# Altium schematic sheet 03_MICROSD.SchDoc
size A3; SheetNumber: 3; SheetTotal: 7
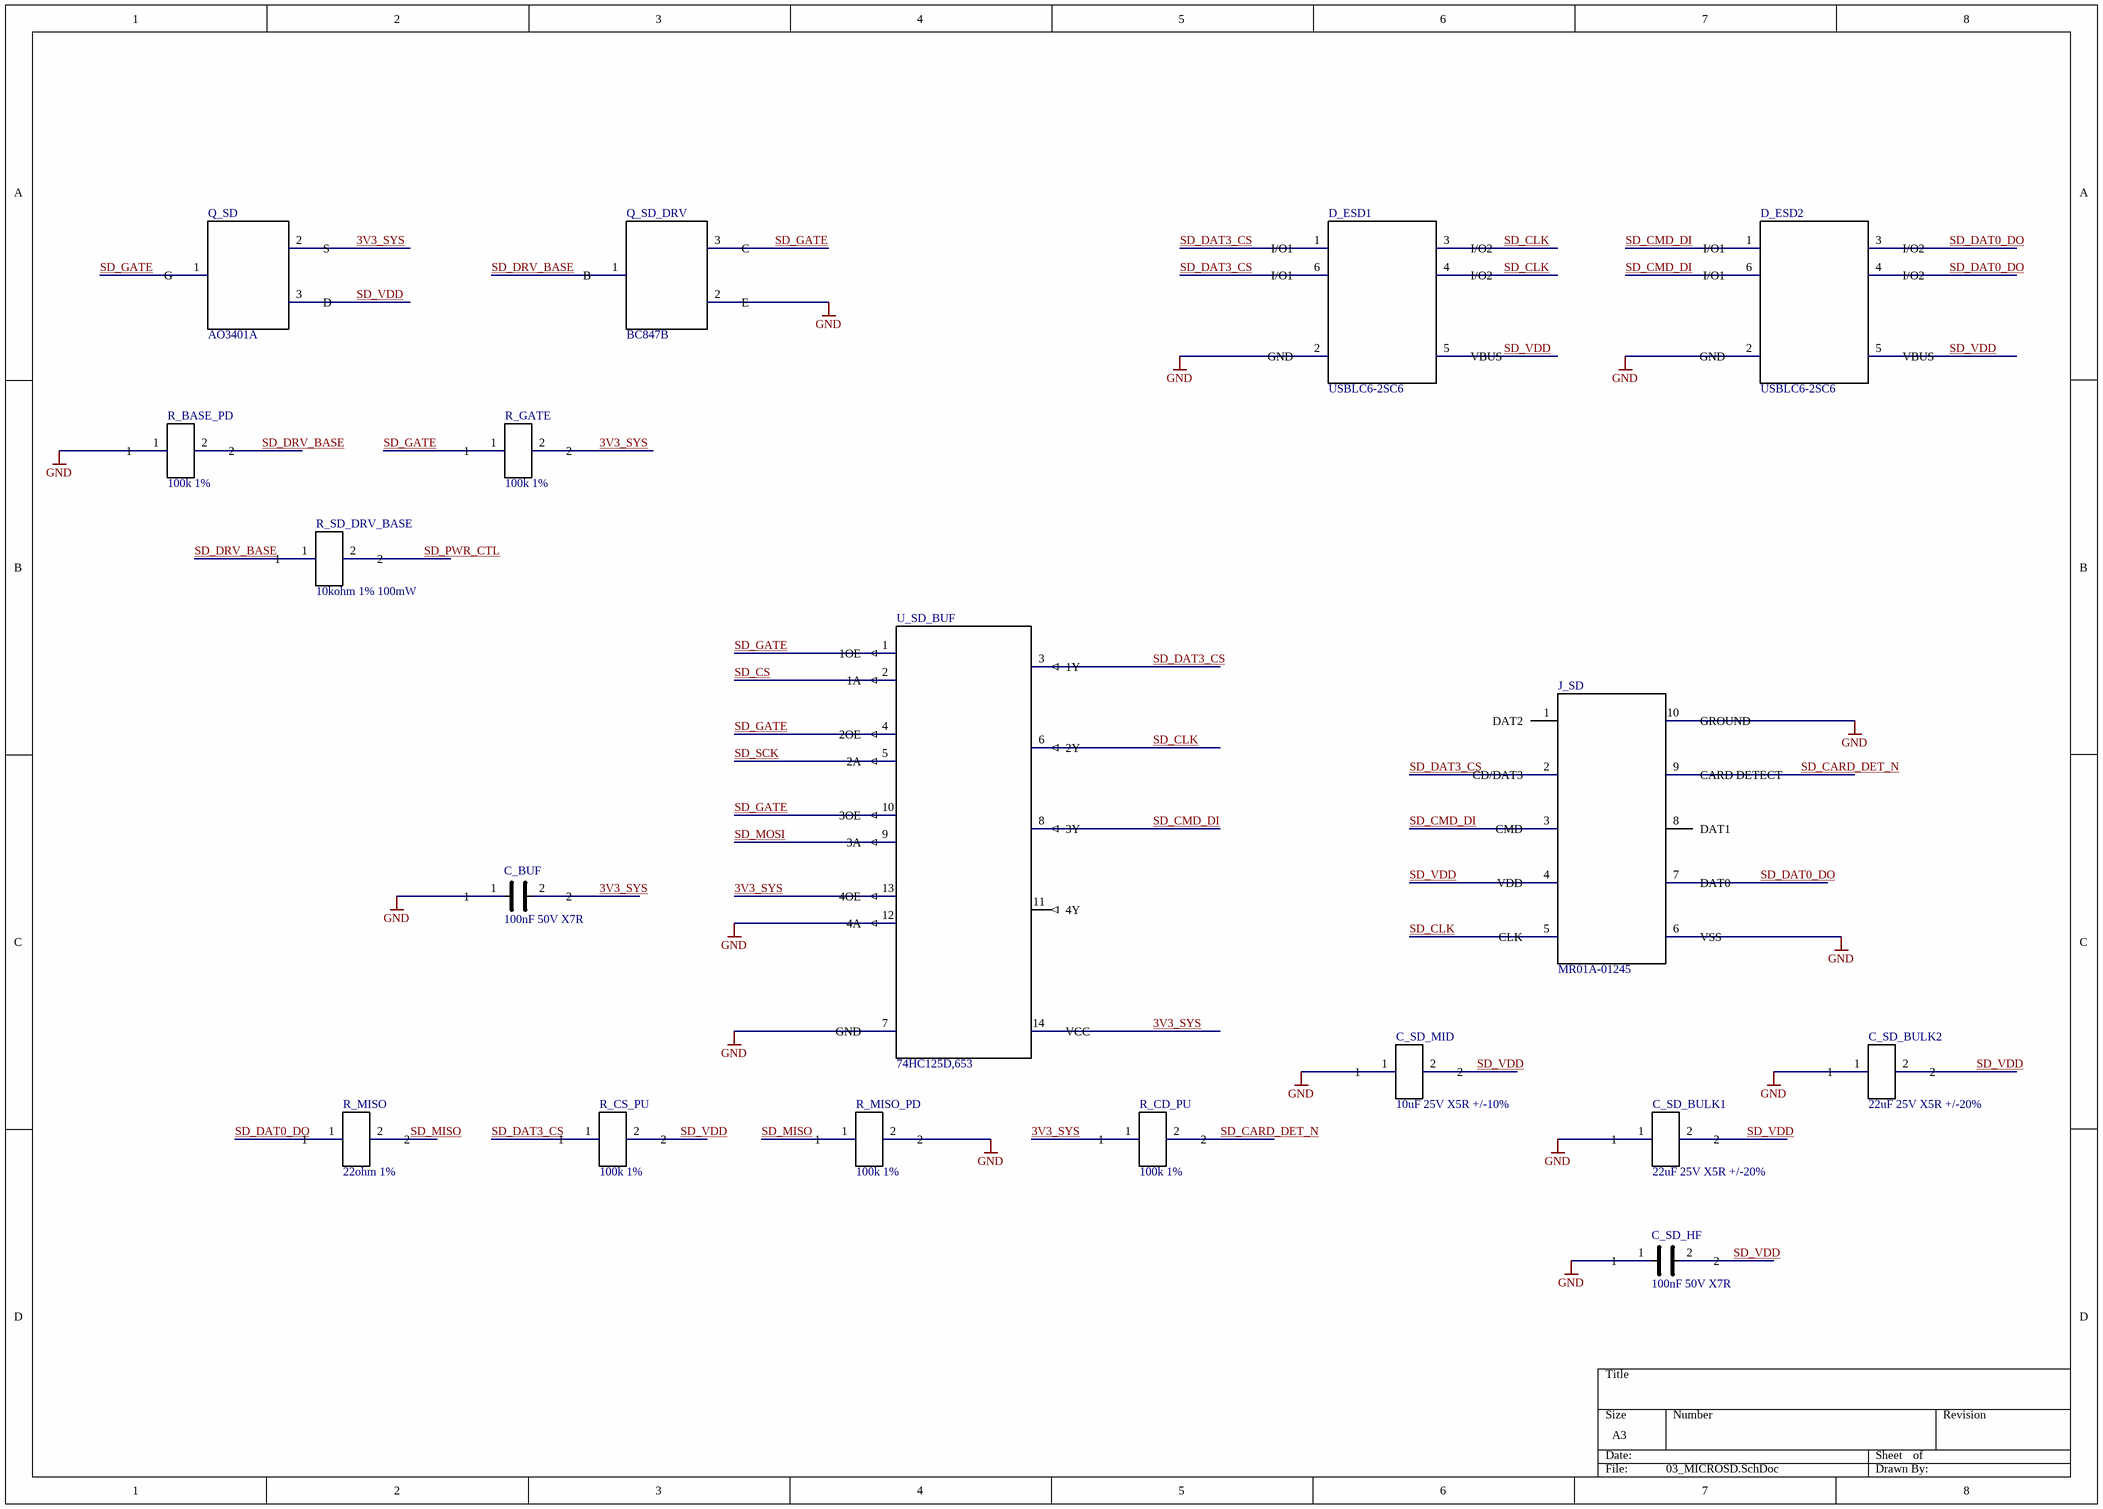
[diagram p0: 03_MICROSD.SchDoc]

## Parts
C_BUF  100nF 50V X7R  [SAMSUNG_CL10_0603_CAP_2P]
C_SD_BULK1  22uF 25V X5R +/-20%  [TDK_C2012_0805_REFLOW_2P]
C_SD_BULK2  22uF 25V X5R +/-20%  [TDK_C2012_0805_REFLOW_2P]
C_SD_HF  100nF 50V X7R  [SAMSUNG_CL10_0603_CAP_2P]
C_SD_MID  10uF 25V X5R +/-10%  [MURATA_GRM21_0805_CAP_2P]
D_ESD1  USBLC6-2SC6  [ST_SOT23_6L_USBLC6_6P]
D_ESD2  USBLC6-2SC6  [ST_SOT23_6L_USBLC6_6P]
J_SD  MR01A-01245  [ATOM_MR01A_01245_10P]
Q_SD  AO3401A  [AOS_SOT23_AO3401A_3P]
Q_SD_DRV  BC847B  [NEXPERIA_SOT23_TO236AB_3P]
R_BASE_PD  100k 1%  [RES_0603_SHARED_2P]
R_CD_PU  100k 1%  [RES_0603_SHARED_2P]
R_CS_PU  100k 1%  [RES_0603_SHARED_2P]
R_GATE  100k 1%  [RES_0603_SHARED_2P]
R_MISO  22ohm 1%  [RES_0603_SHARED_2P]
R_MISO_PD  100k 1%  [RES_0603_SHARED_2P]
R_SD_DRV_BASE  10kohm 1% 100mW  [RES_0603_SHARED_2P]
U_SD_BUF  74HC125D,653  [NEXPERIA_SOT108_1_SO14_14P]

## Nets
GND: C_BUF.1 C_SD_BULK1.1 C_SD_BULK2.1 C_SD_HF.1 C_SD_MID.1 D_ESD1.2(GND) D_ESD2.2(GND) J_SD.6(VSS) J_SD.10(GROUND) Q_SD_DRV.2(E) R_BASE_PD.1 R_MISO_PD.2 U_SD_BUF.7(GND) U_SD_BUF.12(4A)
3V3_SYS: C_BUF.2 Q_SD.2(S) R_CD_PU.1 R_GATE.2 U_SD_BUF.13(4OE) U_SD_BUF.14(VCC)
SD_CARD_DET_N: J_SD.9(CARD_DETECT) R_CD_PU.2
SD_CLK: D_ESD1.3(I/O2) D_ESD1.4(I/O2) J_SD.5(CLK) U_SD_BUF.6(2Y)
SD_CMD_DI: D_ESD2.1(I/O1) D_ESD2.6(I/O1) J_SD.3(CMD) U_SD_BUF.8(3Y)
SD_CS: U_SD_BUF.2(1A)
SD_DAT0_DO: D_ESD2.3(I/O2) D_ESD2.4(I/O2) J_SD.7(DAT0) R_MISO.1
SD_DAT3_CS: D_ESD1.1(I/O1) D_ESD1.6(I/O1) J_SD.2(CD/DAT3) R_CS_PU.1 U_SD_BUF.3(1Y)
SD_DRV_BASE: Q_SD_DRV.1(B) R_BASE_PD.2 R_SD_DRV_BASE.1
SD_GATE: Q_SD.1(G) Q_SD_DRV.3(C) R_GATE.1 U_SD_BUF.1(1OE) U_SD_BUF.4(2OE) U_SD_BUF.10(3OE)
SD_MISO: R_MISO.2 R_MISO_PD.1
SD_MOSI: U_SD_BUF.9(3A)
SD_PWR_CTL: R_SD_DRV_BASE.2
SD_SCK: U_SD_BUF.5(2A)
SD_VDD: C_SD_BULK1.2 C_SD_BULK2.2 C_SD_HF.2 C_SD_MID.2 D_ESD1.5(VBUS) D_ESD2.5(VBUS) J_SD.4(VDD) Q_SD.3(D) R_CS_PU.2

Not connected (* = marked no-connect by the designer): J_SD 1(DAT2) 8(DAT1); U_SD_BUF 11(4Y)

## Library data of the parts
C_BUF C_SD_HF = CL10B104KB8NNNC: MCU-core ceramic capacitor; Manufacturer: Samsung Electro-Mechanics; Source_Baseline: MCU_SCHEMATIC_ENTRY_BASELINE_v2.1_FA.txt; Design_Status: DESIGN_LOCK_MCU_CORE_V2.1_FOOTPRINT_HOLD; Qualification_Status: UNQUALIFIED_PENDING_SAVE_REOPEN_AUDIT; PIN_NUMBER_SOURCE: INTERNAL_CONVENTION; PIN_FUNCTION_SOURCE: MANUFACTURER_DATASHEET; MPN: CL10B104KB8NNNC; Value: 100nF 50V X7R; Package: 0603 / 1608 metric; Datasheet: https://product.samsungsem.com/mlcc/CL10B104KB8NNN.do
C_SD_BULK1 C_SD_BULK2 = C2012X5R1E226M125AC: MicroSD local bulk ceramic capacitor; Manufacturer: TDK; Source_Baseline: MICROSD_SCHEMATIC_ENTRY_BASELINE_v1.2_FA.txt; Design_Status: DESIGN_LOCK_MICROSD_V1.2_REUSE_CANDIDATE_PENDING_LINK; Qualification_Status: UNQUALIFIED_PENDING_SAVE_REOPEN_AUDIT; PIN_NUMBER_SOURCE: INTERNAL_CONVENTION_1_2; PIN_FUNCTION_SOURCE: MANUFACTURER_PRODUCT_DATA; MPN: C2012X5R1E226M125AC; Value: 22uF 25V X5R +/-20%; Package: C2012 / EIA 0805; Datasheet: https://product.tdk.com/en/search/capacitor/ceramic/mlcc/info?part_no=C2012X5R1E226M125AC
C_SD_MID = GRM21BR61E106KA73L: MicroSD local mid-value ceramic capacitor; Manufacturer: Murata Manufacturing; Source_Baseline: MICROSD_SCHEMATIC_ENTRY_BASELINE_v1.2_FA.txt; Design_Status: DESIGN_LOCK_MICROSD_V1.2_FOOTPRINT_COMPARE_PENDING; Qualification_Status: UNQUALIFIED_PENDING_SAVE_REOPEN_AUDIT; PIN_NUMBER_SOURCE: INTERNAL_CONVENTION_1_2; PIN_FUNCTION_SOURCE: MANUFACTURER_PRODUCT_DATA; MPN: GRM21BR61E106KA73L; Value: 10uF 25V X5R +/-10%; Package: 2012M / EIA 0805; Datasheet: https://pim.murata.com/en-global/pim/details/?partNum=GRM21BR61E106KA73%23
D_ESD1 D_ESD2 = USBLC6-2SC6: Two-line low-capacitance ESD protector; ST device purchased for Rev-A; Manufacturer: STMicroelectronics; Source_Baseline: MICROSD_SCHEMATIC_ENTRY_BASELINE_v1.2_FA.txt; Design_Status: DESIGN_LOCK_MICROSD_V1.2_ST_PROCUREMENT; Qualification_Status: UNQUALIFIED_PENDING_SAVE_REOPEN_AUDIT; PIN_NUMBER_SOURCE: MANUFACTURER_DATASHEET; MPN: USBLC6-2SC6; Value: USBLC6-2SC6; Package: SOT23-6L; Datasheet: https://www.st.com/resource/en/datasheet/usblc6-2.pdf; PIN_FUNCTION_SOURCE: MANUFACTURER_DATASHEET
J_SD = MR01A-01245: microSD socket with card detect; pin table controlled by ATOM-A10248 Rev A0; Manufacturer: Shenzhen ATOM Technology; Source_Baseline: MICROSD_SCHEMATIC_ENTRY_BASELINE_v1.2_FA.txt; Design_Status: DESIGN_LOCK_MICROSD_V1.2_SOCKET_DRAWING; Qualification_Status: UNQUALIFIED_PENDING_SAVE_REOPEN_AUDIT; PIN_NUMBER_SOURCE: MANUFACTURER_DRAWING; MPN: MR01A-01245; Value: MR01A-01245; Package: Right-angle SMD/SMT microSD socket; Datasheet: ATOM-A10248 Rev A0 controlled local manufacturer drawing; PIN_FUNCTION_SOURCE: MANUFACTURER_DRAWING
Q_SD = AO3401A: -30V P-channel MOSFET used as switched SD_VDD high-side pass element; Manufacturer: Alpha & Omega Semiconductor; Source_Baseline: MICROSD_SCHEMATIC_ENTRY_BASELINE_v1.2_FA.txt; Design_Status: DESIGN_LOCK_MICROSD_V1.2_PIN_NUMBER_CONVENTION_PENDING_FOOTPRINT_CROSSCHECK; Qualification_Status: UNQUALIFIED_PENDING_SAVE_REOPEN_AUDIT; PIN_NUMBER_SOURCE: INTERNAL_CONVENTION_PENDING_PHYSICAL_ORIENTATION_CROSSCHECK; PIN_FUNCTION_SOURCE: MANUFACTURER_DATASHEET; MPN: AO3401A; Value: AO3401A; Package: SOT-23; Datasheet: https://www.aosmd.com/sites/default/files/res/datasheets/AO3401A.pdf
Q_SD_DRV = BC847B: 45V 100mA NPN general-purpose transistor used as SD gate driver; Manufacturer: Nexperia; Source_Baseline: MICROSD_SCHEMATIC_ENTRY_BASELINE_v1.2_FA.txt; Design_Status: DESIGN_LOCK_MICROSD_V1.2; Qualification_Status: UNQUALIFIED_PENDING_SAVE_REOPEN_AUDIT; PIN_NUMBER_SOURCE: MANUFACTURER_DATASHEET; MPN: BC847B; Value: BC847B; Package: SOT-23 / TO-236AB; Datasheet: https://assets.nexperia.com/documents/data-sheet/BC847X_SER.pdf; PIN_FUNCTION_SOURCE: MANUFACTURER_DATASHEET
R_BASE_PD R_CD_PU R_CS_PU R_GATE R_MISO_PD = 0603WAF1003T5E: OVP resistor; Manufacturer: UNI-ROYAL; Source_Baseline: POWER_SCHEMATIC_ENTRY_BASELINE_v0.17_FA.txt; Design_Status: CONTROLLED_V0.17_P9; Qualification_Status: UNQUALIFIED_PENDING_SAVE_REOPEN_AUDIT; PIN_NUMBER_SOURCE: INTERNAL_CONVENTION; PIN_FUNCTION_SOURCE: MANUFACTURER_DATASHEET; MPN: 0603WAF1003T5E; Value: 100k 1%; Package: 0603; Datasheet: UNI-ROYAL manufacturer resistor data
R_MISO = SER0603F22R: MicroSD MISO series resistor; Manufacturer: VO Sub Brand (ER) [supplier-listed]; Source_Baseline: MICROSD_SCHEMATIC_ENTRY_BASELINE_v1.2_FA.txt; Design_Status: DESIGN_LOCK_MICROSD_V1.2_FOOTPRINT_SOURCE_HOLD; Qualification_Status: UNQUALIFIED_PENDING_SAVE_REOPEN_AUDIT; PIN_NUMBER_SOURCE: INTERNAL_CONVENTION_1_2; PIN_FUNCTION_SOURCE: CONTROLLED_BOM_PLUS_SUPPLIER_LISTING; MPN: SER0603F22R; Value: 22ohm 1%; Package: 0603; Datasheet: https://lionelectronic.ir/products/1154-SER0603F22R
R_SD_DRV_BASE = CR0603FA1002G: MicroSD SD gate-driver base resistor; Manufacturer: LIZ [supplier-listed]; Source_Baseline: MICROSD_SCHEMATIC_ENTRY_BASELINE_v1.2_FA.txt; Design_Status: DESIGN_LOCK_MICROSD_V1.2_FOOTPRINT_SOURCE_HOLD; Qualification_Status: UNQUALIFIED_PENDING_SAVE_REOPEN_AUDIT; PIN_NUMBER_SOURCE: INTERNAL_CONVENTION_1_2; PIN_FUNCTION_SOURCE: CONTROLLED_BOM_PLUS_EXACT_PART_LISTING; MPN: CR0603FA1002G; Value: 10kohm 1% 100mW; Package: 0603; Datasheet: MicroSD v1.3 plus exact-part supplier listing
U_SD_BUF = 74HC125D,653: Quad buffer/line driver with 3-state outputs; OE active-low; Manufacturer: Nexperia; Source_Baseline: MICROSD_SCHEMATIC_ENTRY_BASELINE_v1.2_FA.txt; Design_Status: DESIGN_LOCK_MICROSD_V1.2; Qualification_Status: UNQUALIFIED_PENDING_SAVE_REOPEN_AUDIT; PIN_NUMBER_SOURCE: MANUFACTURER_DATASHEET; MPN: 74HC125D,653; Value: 74HC125D,653; Package: SO14 / SOT108-1; Datasheet: https://assets.nexperia.com/documents/data-sheet/74HC_HCT125.pdf; PIN_FUNCTION_SOURCE: MANUFACTURER_DATASHEET